# EasyEDA Pro project utf8-attributes.epro

# Schematic Main
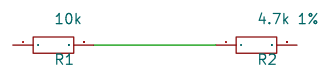
[diagram p0: schematic sheet]

## Parts
R1  10k
R2  -

## Library data of the parts
R1 = RES 1: 类型: 贴片电阻
R2 = RES 2: 阻值: 4.7k; 精度: 1%

## Nets
MID: R1.2 R2.1

Not connected (* = marked no-connect by the designer): R1 1; R2 2
